# Altium schematic sheet NanoD1_Wireless.SchDoc
size 420 x 297 mm; SheetNumber: 6; SheetTotal: 8
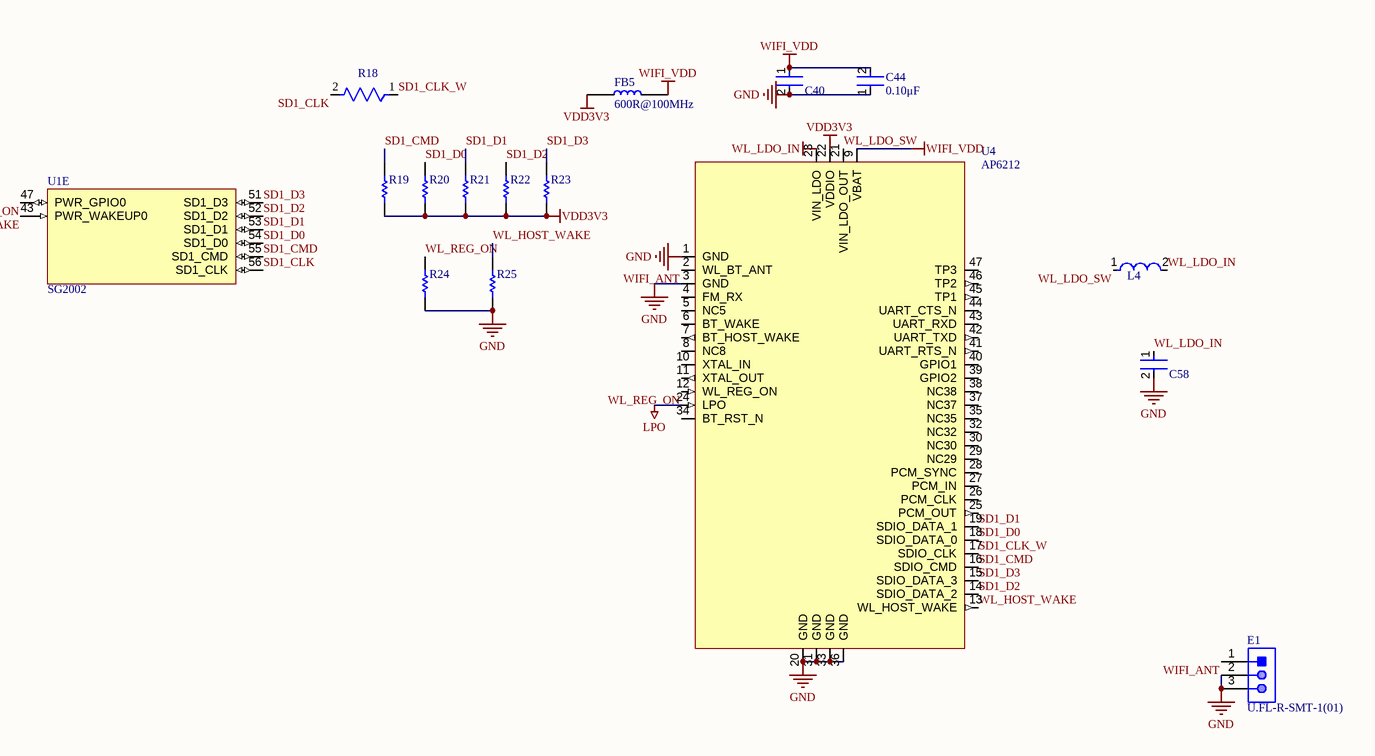
[diagram p0: NanoD1_Wireless.SchDoc]

## Parts
C40  10uF  [FP-GRM188-0_15-IPC_B]  (value not drawn)
C44  value 0.10μF  [FP-GRM15-MFG]  (hidden comment: 100nF)
C58  10uF  [FP-GRM188-0_15-IPC_B]  (value not drawn)
E1  U.FL-R-SMT-1(01)  [HRS-U.FL-R-SMT-3_V]
FB5  600R@100MHz  [INDC1608X95N]
L4  4.7uH  [FP-DFE252010C-MFG]  (value not drawn)
R18  22R  [FP-RC0402-0_4-IPC_A]  (value not drawn)
R19  10K  [RESC1005X40X25ML05T10]  (value not drawn)
R20  10K  [RESC1005X40X25ML05T10]  (value not drawn)
R21  10K  [RESC1005X40X25ML05T10]  (value not drawn)
R22  10K  [RESC1005X40X25ML05T10]  (value not drawn)
R23  10K  [RESC1005X40X25ML05T10]  (value not drawn)
R24  10K  [RESC1005X40X25ML05T10]  (value not drawn)
R25  10K  [RESC1005X40X25ML05T10]  (value not drawn)
U1  SG2002  [QFN88-9x9-0.35]  (part E of 7)
U4  AP6212  [AP6212-12x12]

## Nets
GND: C40.2 C44.1 C58.2 E1.2 E1.3 R24.1 R25.1 U4.1(GND) U4.3(GND) U4.20(GND) U4.31(GND) U4.33(GND) U4.36(GND)
LPO: U4.24(LPO)
VDD3V3: FB5.1 R19.1 R20.1 R21.1 R22.1 R23.1 U4.22(VDDIO)
WIFI_VDD: C40.1 C44.2 FB5.2 U4.9(VBAT)
WL_LDO_IN: C58.1 L4.2 U4.23(VIN_LDO)
SD1_CLK: R18.2 U1.56(SD1_CLK)
SD1_CLK_W: R18.1 U4.17(SDIO_CLK)
SD1_CMD: R19.2 U1.55(SD1_CMD) U4.16(SDIO_CMD)
SD1_D0: R20.2 U1.54(SD1_D0) U4.18(SDIO_DATA_0)
SD1_D1: R21.2 U1.53(SD1_D1) U4.19(SDIO_DATA_1)
SD1_D2: R22.2 U1.52(SD1_D2) U4.14(SDIO_DATA_2)
SD1_D3: R23.2 U1.51(SD1_D3) U4.15(SDIO_DATA_3)
WIFI_ANT: E1.1 U4.2(WL_BT_ANT)
WL_HOST_WAKE: R25.2 U1.43(PWR_WAKEUP0) U4.13(WL_HOST_WAKE)
WL_LDO_SW: L4.1 U4.21(VIN_LDO_OUT)
WL_REG_ON: R24.2 U1.47(PWR_GPIO0) U4.12(WL_REG_ON)

Not connected (* = marked no-connect by the designer): U4 4(FM_RX) 5(NC5) 6(BT_WAKE) 7(BT_HOST_WAKE) 8(NC8) 10(XTAL_IN) 11(XTAL_OUT) 25(PCM_OUT) 26(PCM_CLK) 27(PCM_IN) 28(PCM_SYNC) 29(NC29) 30(NC30) 32(NC32) 34(BT_RST_N) 35(NC35) 37(NC37) 38(NC38) 39(GPIO2) 40(GPIO1) 41(UART_RTS_N) 42(UART_TXD) 43(UART_RXD) 44(UART_CTS_N) 45(TP1) 46(TP2) 47(TP3)

## Notes on the sheet
- THIS DOCUMENT AND THE DATA DISCLOSED HEREIN OR
- HEREWITH IS THE PROPERTY OF ALTIUM LIMITED AND MAY
- DWG NO:
- REVISION
- REV:
- DESCRIPTION
- DATE
- APPROVED
- BE FREELY DISTRIBUTED IN WHOLE. NO RIGHTS ARE
- RESERVED OR EXPRESS OR IMPLIED WARANTEE GIVEN.
- ENG:
- APPROVALS
- PROJECT
- DSN:
- CHK:
- REFERENCE DOCUMENTS
- PROJECT REVISION:
- TITLE
- DOCUMENT REVISION:
- DESIGN ITEM:
- BOM:
- FAB DWG:
- PCB DWG:
- ASSY DWG:
- SCALE:
- A3
- SIZE
- CAGE CODE
- FILE NAME
- DWG NO.
- SHEET
- OF
- REV

## Library data of the parts
C40 C58 = CMP-06035-003612-1: Chip Multilayer Ceramic Capacitors for General Purpose, 0603, 10uF, X5R, 15%, 20%, 10V; Tolerance: 20%; Dielectric: X5R; Package Quantity: 4000; Width: 0.8mm; Case/Package: 0603; Thickness: 0.035inch; Capacitance: 10uF; Voltage Rating: 10V; Voltage Rating (DC): 10V; Termination: SMD/SMT; Length: 1.6mm; Lead Free: Lead Free; Mount: Surface Mount; Height: 0.8mm; Depth: 0.8mm; Packaging: Tape and Reel; Weight: 0.000222oz; Min Operating Temperature: -55°C; Case Code (Metric): 1608; Max Operating Temperature: 85°C; Case Code (Imperial): 0603; Material: Ceramic
C44 = CMP-2100-03641-2: CAP CER 0.1UF 16V X7R 0402; Manufacturer Part Number: GRM155R71C104KA88D; Manufacturer: Murata; Standoff Height: 0mm; Tolerance: 10%; Voltage Rating: 16Vdc; Material: Ceramic; RoHS: TRUE; Temperature Characteristic: X7R; Octopart: https://octopart.com/grm155r71c104ka88d-murata-196880; Digikey Description: CAP CER 0.1UF 16V X7R 0402; Device Class L3: Ceramic Capacitors; Height: 0.55mm; ComponentLink2Description: Datasheet; Temperature Range Low: -55°C; Ipc Land Pattern Name: CAPC10050X219; ComponentLink2URL: https://search.murata.co.jp/Ceramy/image/img/A01X/G101/ENG/GRM155R71H471KA01-01A.pdf; Device Class L1: Passive Components; Lead Free: yes; Category: Cap; Package: GRM15; Temperature: -55°C to +125°C; Device Class L2: Capacitors; Capacitance: 0.10μF; Temperature Range High: +125°C; Mouser Description: 0402 0.1 uF 16V ±10 % Tolerance X7R SMT Multilayer Ceramic Capacitor
E1 = CMP-2000-05153-1: Ultra Small Coaxial Connector, 6 GHz, -40 to 90 degC, 3-Pin SMD, RoHS, Bulk; Manufacturer: Hirose Electric; Connector Style: U.FL; Impedance: 50Ohm; Dielectric Material: LiquidCrystalPolymer(LCP); Minimum Quantity: UltraMiniatureCoaxial; Online Catalog: U.FLSeries; Featured Product: HiroseU.FLSeries; Frequency - Max: 6GHz; Other Names: H122041 / U.FL-R-SMT-1(01)-ND; Contact Termination: Solder; Body Material: PhosphorBronze; Connector Type: Jack,MalePin; Body Finish: Silver; Center Contact Plating: Gold; Manufacturer URL: https://www.hirose.com; Family: CoaxialConnectors(RF); Fastening Type: Snap-On; Unit PriceUSD: U.FL; Series: U.FL; Package Reference: U.FL-R-SMT; Packaging: Bulk; Standard Package: 100; Mounting Type: SurfaceMount; Quantity Available: Bulk; Housing Color: Silver; Package Description: 3-Pin Surface Mount Device, Body 2.6 x 2.6 mm; Category: Connectors,Interconnects; Operating Temperature: -40degC~90degC; Center Contact Material: PhosphorBronze; Dynamic Catalog: U.FLSeries; Datasheet URL: https://datasheet.ciiva.com/26945/getdatasheetpartid-475239-26945414.pdf; Datasheet Version: Feb-09; Shield Termination: Solder
FB5 = MPZ1608S601ATA00: 600 Ohms @ 100 MHz 1 Power Line Ferrite Bead 0603 (1608 Metric) 1A 150mOhm; MF: TDK; SnapEDA_Link: https://www.snapeda.com/parts/MPZ1608S601ATA00/TDK/view-part/?ref=snap; Package: 0603 TDK; Value: 600R@100MHz; MP: MPZ1608S601ATA00; Check_prices: https://www.snapeda.com/parts/MPZ1608S601ATA00/TDK/view-part/?ref=eda
L4 = CMP-06042-014898-1: Shielded Wirewound Inductor 4.7uH  1100mA 0.27Ω 1008 (2520); Core Material: Ferrite; Test Frequency: 1MHz; Current Rating: 1.7A; Max DC Current: 1.1A; DC Resistance (DCR): 270mR; Tolerance: 20%; Max Operating Temperature: 125°C; Length: 0.098inch; Inductance: 4.7uH; Height - Seated (Max): 0.039inch; Min Operating Temperature: -40°C; Case Code (Imperial): 1008; Mount: Surface Mount; Resistor Type: Wirewound; Shielding: Shielded; Case Code (Metric): 2520; Case/Package: 1008; Width: 0.079inch; Depth: 2mm; Packaging: Tape and Reel
R18 = CMP-2002-07520-2: Tolerance: 1%; Power Rating: 63mW; Voltage Rating: 50V; Temperature Coefficient: 100ppm/°C; Resistance: 22Ω; Termination: SMD/SMT; Depth: 500µm; Packaging: Tape & Reel; Height: 400µm; Width: 500µm; Case Code (Imperial): 0402; Length: 1mm; Schedule B: 8533210045, 8533210045|8533210045|8533210045|8533210045|8533210045|8533210045|8533210045|8533210045, 8533210045|8533210045|8533210045|8533210045|8533210045|8533210045|8533210045|8533210045|8533210045, 8533210045|8533210045|8533210045|8533210045|8533210045|8533210045|8533210045|8533210045|8533210045|8533210045; Case/Package: 0402; Max Operating Temperature: 155°C; Min Operating Temperature: -55°C; REACH SVHC: Unknown; RoHS: Compliant; Military Standard: Not; Voltage Rating (DC): 50V; Lead Free: Lead Free; Voltage Rating (AC): 50V; Number of Pins: 2; Composition: Thick Film
R19-R25 = CMP-2002-07353-1: Part Number: RC0402FR-0710KL; Manufacturer: Yageo / Phycomp
U1 = SG2002: RISC-V C906 / Cortex-A53 SoC, 256MB DDR3 SiP, QFN88 9x9 0.35mm